# Altium project V3_Board.PrjPcb (part 9 of 9)

## Sheet GSM_Sheet.SchDoc
size A3
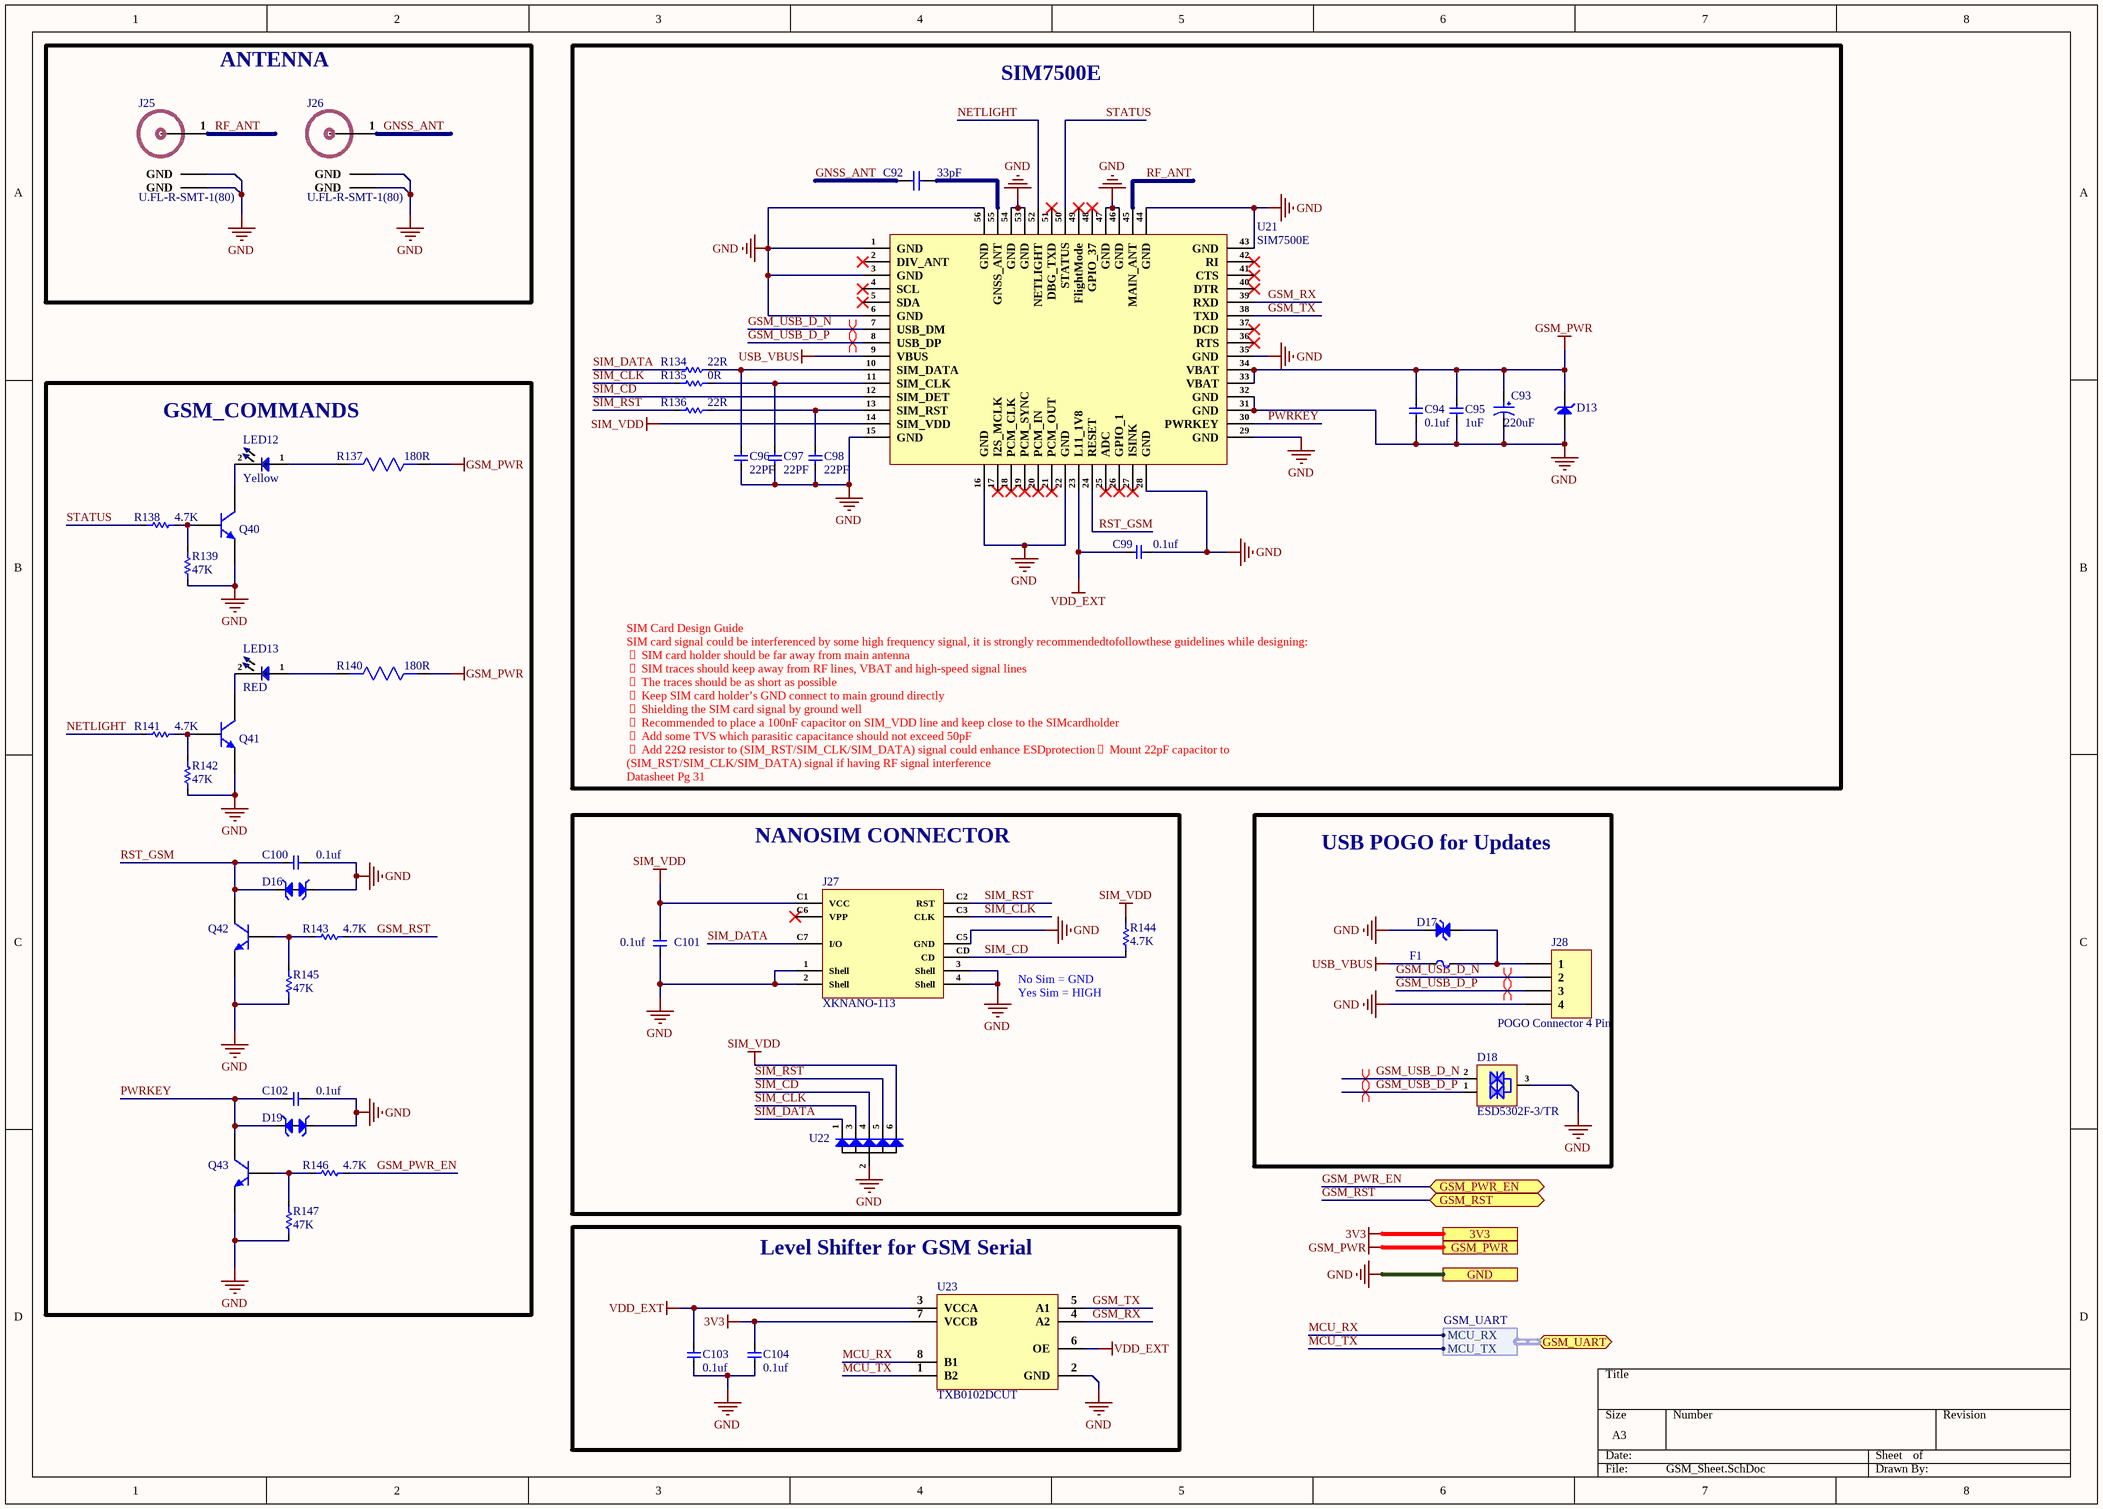
[diagram p20: GSM_Sheet.SchDoc]

### Parts
C92  33pF  [Cap-0402]
C93  220uF  [Case-B]
C94  0.1uf  [Cap-0402]
C95  1uF  [Cap-0402]
C96  22PF  [Cap-0402]
C97  22PF  [Cap-0402]
C98  22PF  [Cap-0402]
C99  0.1uf  [Cap-0402]
C100  0.1uf  [Cap-0402]
C101  0.1uf  [Cap-0402]
C102  0.1uf  [Cap-0402]
C103  0.1uf  [Cap-0402]
C104  0.1uf  [Cap-0402]
D13  MMSZ5231BT1G  [SOD-123]  (value not drawn)
D16  ESD5651N-2/TR  [DFN1006-2L_]  (value not drawn)
D17  PESD5V0H1BSFYL  [DSN0603-2]  (value not drawn)
D18  ESD5302F-3/TR  [Sot-23]
D19  ESD5651N-2/TR  [DFN1006-2L_]  (value not drawn)
F1  SMD0603-050  [Fuse-0603]  (value not drawn)
J25  U.FL-R-SMT-1(80)  [U.FL-R-SMT-1(80)_]
J26  U.FL-R-SMT-1(80)  [U.FL-R-SMT-1(80)_]
J27  XKNANO-113  [XKNANO-113]
J28  POGO Connector 4 Pin  [Pogo 4 Pin]
LED12  Yellow  [LED-0603]
LED13  RED  [LED-0603]
Q40  MMBT2222A-7-F  [SOT-23]  (value not drawn)
Q41  MMBT2222A-7-F  [SOT-23]  (value not drawn)
Q42  MMBT2222A-7-F  [SOT-23]  (value not drawn)
Q43  MMBT2222A-7-F  [SOT-23]  (value not drawn)
R134  22R  [Res-0402]
R135  0R  [Res-0402]
R136  22R  [Res-0402]
R137  180R  [Res-0603]
R138  4.7K  [Res-0402]
R139  47K  [Res-0402]
R140  180R  [Res-0603]
R141  4.7K  [Res-0402]
R142  47K  [Res-0402]
R143  4.7K  [Res-0402]
R144  4.7K  [Res-0402]
R145  47K  [Res-0402]
R146  4.7K  [Res-0402]
R147  47K  [Res-0402]
U21  SIM7500E  [SIM7500E]
U22  SMF05CT1G-ES  [SOT-363]  (value not drawn)
U23  TXB0102DCUT  [VSSOP-8(2x2.3x0.5)]

### Blocks framed on the sheet
ANTENNA: J25 J26
SIM7500E: C92-C99 D13 R134-R136 U21
GSM_COMMANDS: C100 C102 D16 D19 LED12 LED13 Q40-Q43 R137-R143 R145-R147
NANOSIM CONNECTOR: C101 J27 R144 U22
USB POGO for Updates: D17 D18 F1 J28
Level Shifter for GSM Serial: C103 C104 U23

### Ports
3V3, GND, GSM_PWR, GSM_PWR_EN (bidir), GSM_RST (bidir), GSM_UART (bidir, harness GSM_UART)

### Harnesses
GSM_UART: MCU_RX, MCU_TX

### Nets
3V3: C104.1 U23.7(VCCB) ; port 3V3
GND: C93.2 C94.1 C95.1 C96.1 C97.1 C98.1 C99.2 C100.1 C101.2 C102.1 C103.2 C104.2 D13.1(A) D16.2(K) D17.1(A) D18.3(GND) D19.2(K) J25.2(GND) J25.3(GND) J26.2(GND) J26.3(GND) J27.1(Shell) J27.2(Shell) J27.3(Shell) J27.4(Shell) J27.C5(GND) J28.4 Q40.2(E) Q41.2(E) Q42.2(E) Q43.2(E) R139.1 R142.1 R145.1 R147.1 U21.1(GND) U21.3(GND) U21.6(GND) U21.15(GND) U21.16(GND) U21.22(GND) U21.28(GND) U21.29(GND) U21.31(GND) U21.32(GND) U21.35(GND) U21.43(GND) U21.44(GND) U21.46(GND) U21.47(GND) U21.53(GND) U21.54(GND) U21.56(GND) U22.2(A) U23.2(GND) ; port GND
GSM_PWR: C93.1 C94.2 C95.2 D13.2(K) R137.1 R140.1 U21.33(VBAT) U21.34(VBAT) ; port GSM_PWR
SIM_VDD: C101.1 J27.C1(VCC) R144.1 U21.14(SIM_VDD) U22.6(IO5)
USB_VBUS: F1.1 U21.9(VBUS)
VDD_EXT: C99.1 C103.1 U21.23(L11_1V8) U23.3(VCCA) U23.6(OE)
GNSS_ANT: C92.2 J26.1(RF_IN)
GSM_PWR_EN: R146.2 ; port GSM_PWR_EN
GSM_RST: R143.2 ; port GSM_RST
GSM_RX: U21.39(RXD) U23.4(A2)
GSM_TX: U21.38(TXD) U23.5(A1)
GSM_USB_D_N: D18.2(I/O2) J28.2 U21.7(USB_DM)
GSM_USB_D_P: D18.1(I/O1) J28.3 U21.8(USB_DP)
MCU_RX: U23.8(B1) ; port GSM_UART.MCU_RX
MCU_TX: U23.1(B2) ; port GSM_UART.MCU_TX
NETLIGHT: R141.1 U21.52(NETLIGHT)
PWRKEY: C102.2 D19.1(K) Q43.3(C) U21.30(PWRKEY)
RF_ANT: J25.1(RF_IN) U21.45(MAIN_ANT)
RST_GSM: C100.2 D16.1(K) Q42.3(C) U21.24(RESET)
SIM_CD: J27.CD R144.2 U21.12(SIM_DET) U22.4(IO3)
SIM_CLK: J27.C3(CLK) R135.1 U22.3(IO2)
SIM_DATA: J27.C7(I/O) R134.1 U22.1(IO1)
SIM_RST: J27.C2(RST) R136.1 U22.5(IO4)
STATUS: R138.1 U21.50(STATUS)
NetC92_1: C92.1 U21.55(GNSS_ANT)
NetC96_2: C96.2 R134.2 U21.10(SIM_DATA)
NetC97_2: C97.2 R135.2 U21.11(SIM_CLK)
NetC98_2: C98.2 R136.2 U21.13(SIM_RST)
NetD17_2: D17.2(A) F1.2 J28.1
NetLED12_1: LED12.1 R137.2
NetLED12_2: LED12.2 Q40.3(C)
NetLED13_1: LED13.1 R140.2
NetLED13_2: LED13.2 Q41.3(C)
NetQ40_1: Q40.1(B) R138.2 R139.2
NetQ41_1: Q41.1(B) R141.2 R142.2
NetQ42_1: Q42.1(B) R143.1 R145.2
NetQ43_1: Q43.1(B) R146.1 R147.2

Not connected (* = marked no-connect by the designer): J27 C6(VPP)*; U21 2(DIV_ANT)* 4(SCL)* 5(SDA)* 17(I2S_MCLK)* 18(PCM_CLK)* 19(PCM_SYNC)* 20(PCM_IN)* 21(PCM_OUT)* 25(ADC)* 26(GPIO_1)* 27(ISINK)* 36(RTS)* 37(DCD)* 40(DTR)* 41(CTS)* 42(RI)* 48(GPIO_37)* 49(FlightMode)* 51(DBG_TXD)*

### Layout directives
differential pair; net class GSM_USB; differential pair class GSM_USB_Lines; rule Impedance Constraint [Min = 88.00    Max = 90.00    ]; rule Matched Net Lengths [Tolerance = 20mil]: GSM_USB_D_N, GSM_USB_D_P

### Notes on the sheet
- SIM Card Design Guide
  SIM card signal could be interferenced by some high frequency signal, it is strongly recommendedtofollowthese guidelines while designing:
   SIM card holder should be far away from main antenna
   SIM traces should keep away from RF lines, VBAT and high-speed signal lines
   The traces should be as short as possible
   Keep SIM card holder’s GND connect to main ground directly
   Shielding the SIM card signal by ground well
   Recommended to place a 100nF capacitor on SIM_VDD line and keep close to the SIMcardholder
   Add some TVS which parasitic capacitance should not exceed 50pF
   Add 22Ω resistor to (SIM_RST/SIM_CLK/SIM_DATA) signal could enhance ESDprotection Mount 22pF capacitor to (SIM_RST/SIM_CLK/SIM_DATA) signal if having RF signal interference
  Datasheet Pg 31
- (near R144) No Sim = GND
  Yes Sim = HIGH

### Library data of the parts
C92 = GRM1555C1E330JA01D: CAP CER 33PF 25V C0G/NP0 0402; Manufacturer: Murata; Tolerance: 5%; Dielectric: C0G; Supplier 1: Digi-Key; Manufacturer Part Number: GRM1555C1E330JA01D; Stock 1: 250773; Pricing 1: 1=0.1, 10=0.034, 50=0.0184, 100=0.0151, 500=0.01078, 1000=0.00847, 2500=0.0077, 5000=0.00708 (USD); Mount: Surface Mount; Case/Package: 0402; Case Code (Metric): 1005; Case Code (Imperial): 0402; Min Operating Temperature: -55°C; Max Operating Temperature: 125°C; Capacitance: 33pF; Package Quantity: 1; Voltage Rating: 25V; Packaging: Tape and Reel; Voltage Rating (DC): 25V; Termination: SMD/SMT; Voltage: 25V; Series: GRM; Construction: Flat; Length: 1mm; Width: 0.02inch; Height: 0.5mm; Thickness: 0.022inch; Depth: 0.5mm; Radiation Hardening: No; Lead Free: Lead Free; RoHS Compliant: Yes; ComponentLink1URL: https://www.murata.com/~/media/webrenewal/support/library/catalog/products/capacitor/mlcc/c02e.ashx?la=en-us&src-supplier=Digi-Key; ComponentLink1Description: https://www.murata.com/~/media/webrenewal/support/library/catalog/products/capacitor/mlcc/c02e.ashx?la=en-us&src-supplier=Digi-Key; ComponentLink2URL: http://www.mouser.com/ds/2/281/c02e-2905.pdf?src-supplier=Mouser; ComponentLink2Description: http://www.mouser.com/ds/2/281/c02e-2905.pdf?src-supplier=Mouser; ComponentLink3URL: http://psearch.murata.com/capacitor/product/GRM1555C1E330JA01%23.pdf?src-supplier=Avnet; ComponentLink3Description: http://psearch.murata.com/capacitor/product/GRM1555C1E330JA01%23.pdf?src-supplier=Avnet; Supplier Part Number 1: 490-6177-1-ND; LCSC Part Number: C441758
C93 = TLJB227M006R0500: CAP TANT 220UF 20% 6.3V SMD; Manufacturer: Kyocera AVX; Dielectric Material: Tantalum; Ripple Current: 412mA; ESR (Equivalent Series Resistance): 500mR; Leakage Current: 13.2uA; Polarity: Polar; Item Type: Capacitor; Supplier 1: Arrow Electronics; Manufacturer Part Number: TLJB227M006R0500; RoHS: Yes; Category: Tantalum Capacitors; Stock 1: 2000; Pricing 1: 2000=0.5308 (USD); Mounting Technology: Surface Mount; Case/Package: 1210; Pins: 2; Case Code (Imperial): 1411; Case Code (Metric): 3528; Min Operating Temperature: -55°C; Max Operating Temperature: 125°C; Package Quantity: 2000; Voltage Rating: 6.3V; Tolerance: 20%; Packaging: Tape and Reel; Value: 220uF; Termination: SMD/SMT; Voltage Rating (DC): 6.3V; Features: General Purpose; Series: TLJ; Construction: Flat; Length: 3.5mm; Width: 2.8mm; Height: 2.1mm; Height - Seated (Max): 0.083inch; Depth: 2.8mm; Radiation Hardening: No; Reach SVHC Compliant: No; RoHS Compliant: Yes; ComponentLink1URL: https://datasheet.ciiva.com/7773/tlj-7773835.pdf?src-supplier=Element14; ComponentLink1Description: https://datasheet.ciiva.com/7773/tlj-7773835.pdf?src-supplier=Element14; ComponentLink2URL: https://datasheet.ciiva.com/7773/tlj-7773836.pdf?src-supplier=Element14; ComponentLink2Description: https://datasheet.ciiva.com/7773/tlj-7773836.pdf?src-supplier=Element14; ComponentLink3URL: https://datasheet.ciiva.com/12911/tlj-35067-12911143.pdf?src-supplier=Mouser; ComponentLink3Description: https://datasheet.ciiva.com/12911/tlj-35067-12911143.pdf?src-supplier=Mouser; ComponentLink4URL: https://datasheet.ciiva.com/11229/tlj-11229391.pdf?src-supplier=Avnet; ComponentLink4Description: https://datasheet.ciiva.com/11229/tlj-11229391.pdf?src-supplier=Avnet; ComponentLink5URL: https://datasheet.ciiva.com/6238/tlj-6238526.pdf?src-supplier=Digi-Key; ComponentLink5Description: https://datasheet.ciiva.com/6238/tlj-6238526.pdf?src-supplier=Digi-Key; Supplier Part Number 1: TLJB227M006R0500; LCSC Part Number: C30242
C94 C99-C104 = GRM155R62A104KE14D: CAP CER 0.1UF 100V X5R 0402; Manufacturer: Murata; Capacitance: 100nF; Tolerance: 10%; Item Type: Capacitor; Supplier 1: Arrow Electronics; Manufacturer Part Number: GRM155R62A104KE14D; RoHS: Yes; Category: Ceramic Capacitors; Stock 1: 870000; Pricing 1: 10000=0.00500, 20000=0.00410, 30000=0.00390, 50000=0.00370, 100000=0.00300 (USD); Mount: Surface Mount; Case/Package: 0402; Case Code (Metric): 1005; Case Code (Imperial): 0402; Weight: 0.000212oz; Min Operating Temperature: -55°C; Max Operating Temperature: 85°C; Packaging: Tape and Reel; Voltage Rating: 100V; Dielectric: X5R; Termination: SMD/SMT; Voltage Rating (DC): 100V; Package Quantity: 10000; Series: GRM; Length: 0.039inch; Width: 0.02inch; Height: 0.5mm; Thickness: 0.022inch; Reach SVHC Compliant: Yes; Lead Free: Lead Free; RoHS Compliant: Yes; ComponentLink1URL: http://www.farnell.com/datasheets/2079151.pdf?src-supplier=Farnell; ComponentLink1Description: http://www.farnell.com/datasheets/2079151.pdf?src-supplier=Farnell; ComponentLink2URL: http://www.mouser.com/ds/2/281/c02e-2905.pdf?src-supplier=Mouser; ComponentLink2Description: http://www.mouser.com/ds/2/281/c02e-2905.pdf?src-supplier=Mouser; ComponentLink3URL: http://www.farnell.com/datasheets/2079151.pdf?src-supplier=Element14; ComponentLink3Description: http://www.farnell.com/datasheets/2079151.pdf?src-supplier=Element14; ComponentLink4URL: http://search.murata.co.jp/Ceramy/image/img/A01X/G101/ENG/GRM155R62A104KE14-01.pdf?src-supplier=Digi-Key; ComponentLink4Description: http://search.murata.co.jp/Ceramy/image/img/A01X/G101/ENG/GRM155R62A104KE14-01.pdf?src-supplier=Digi-Key; ComponentLink5URL: http://www.farnell.com/datasheets/2079151.pdf?src-supplier=Newark; ComponentLink5Description: http://www.farnell.com/datasheets/2079151.pdf?src-supplier=Newark; Supplier Part Number 1: GRM155R62A104KE14D; LCSC Part Number: C162178
C95 = UMK105CBJ105MV-F: CAP CER 1UF 50V X5R 0402; Manufacturer: Taiyo Yuden; Item Type: Capacitor; Supplier 1: Digi-Key; Manufacturer Part Number: UMK105CBJ105MV-F; Stock 1: 412061; Pricing 1: 1=0.27, 10=0.184, 50=0.1224, 100=0.104, 500=0.07342, 1000=0.06424, 2500=0.06118, 5000=0.05659 (USD); Lead Free: Lead Free; RoHS Compliant: Yes; ComponentLink1URL: http://www.farnell.com/datasheets/2801300.pdf?src-supplier=Newark; ComponentLink1Description: http://www.farnell.com/datasheets/2801300.pdf?src-supplier=Newark; ComponentLink2URL: http://www.farnell.com/datasheets/2801300.pdf?src-supplier=Farnell; ComponentLink2Description: http://www.farnell.com/datasheets/2801300.pdf?src-supplier=Farnell; ComponentLink3URL: https://ds.yuden.co.jp/TYCOMPAS/ut/detail?pn=UMK105CBJ105MV-F &amp;u=M&src-supplier=Digi-Key; ComponentLink3Description: https://ds.yuden.co.jp/TYCOMPAS/ut/detail?pn=UMK105CBJ105MV-F &amp;u=M&src-supplier=Digi-Key; Supplier Part Number 1: 587-6278-1-ND; LCSC Part Number: C2880413
C96-C98 = CC0402JRNPO9BN220: CAP CER 22PF 50V C0G/NPO 0402; Manufacturer: Yageo; Dielectric Material: Ceramic; Tolerance: 5%; Dielectric: C0G; Temperature Coefficient: 30ppm/°C; Insulation Resistance: 100GR; Item Type: Capacitor; Supplier 1: Future Electronics; Manufacturer Part Number: CC0402JRNPO9BN220; RoHS: Yes; Category: Ceramic Capacitors; Stock 1: 200000; Pricing 1: 10000=0.00220, 40000=0.00210, 150000=0.00200, 400000=0.00190, 1000000=0.00180 (USD); Mounting Technology: Surface Mount; Case/Package: 0402; Pins: 2; Case Code (Metric): 1005; Case Code (Imperial): 0402; Min Operating Temperature: -55°C; Max Operating Temperature: 125°C; Value: 22pF; Voltage Rating: 50V; Packaging: Tape and Reel; Package Quantity: 1; Voltage Rating (DC): 50V; Termination: SMD/SMT; Resistor Type: Ceramic; Voltage: 50V; Series: CC; Length: 1mm; Width: 0.02inch; Height: 0.5mm; Thickness: 0.022inch; Depth: 0.5mm; Radiation Hardening: No; Reach SVHC Compliant: Yes; Lead Free: Lead Free; RoHS Compliant: Yes; ComponentLink1URL: https://datasheet.ciiva.com/5789/1443161-5789509.pdf?src-supplier=Farnell; ComponentLink1Description: https://datasheet.ciiva.com/5789/1443161-5789509.pdf?src-supplier=Farnell; ComponentLink2URL: https://datasheet.ciiva.com/8033/1443161-8033606.pdf?src-supplier=Element14; ComponentLink2Description: https://datasheet.ciiva.com/8033/1443161-8033606.pdf?src-supplier=Element14; ComponentLink3URL: https://datasheet.ciiva.com/7656/1132289-7656615.pdf?src-supplier=Element14; ComponentLink3Description: https://datasheet.ciiva.com/7656/1132289-7656615.pdf?src-supplier=Element14; ComponentLink4URL: https://datasheet.ciiva.com/8033/1443161-8033607.pdf?src-supplier=Element14; ComponentLink4Description: https://datasheet.ciiva.com/8033/1443161-8033607.pdf?src-supplier=Element14; ComponentLink5URL: https://datasheet.ciiva.com/8033/1443161-8033605.pdf?src-supplier=Element14; ComponentLink5Description: https://datasheet.ciiva.com/8033/1443161-8033605.pdf?src-supplier=Element14; ComponentLink6URL: https://datasheet.ciiva.com/143/mlccorderingcode-143987.pdf?src-supplier=Digi-Key; ComponentLink6Description: https://datasheet.ciiva.com/143/mlccorderingcode-143987.pdf?src-supplier=Digi-Key; ComponentLink7URL: https://datasheet.ciiva.com/143/mlccorderingcode-143986.pdf?src-supplier=Digi-Key; ComponentLink7Description: https://datasheet.ciiva.com/143/mlccorderingcode-143986.pdf?src-supplier=Digi-Key; ComponentLink8URL: https://datasheet.ciiva.com/143/mlccorderingcode-143988.pdf?src-supplier=Digi-Key; ComponentLink8Description: https://datasheet.ciiva.com/143/mlccorderingcode-143988.pdf?src-supplier=Digi-Key; ComponentLink9URL: https://datasheet.ciiva.com/5425/upy-gp-np0-16v-to-50v-8-5425483.pdf?src-supplier=Mouser; ComponentLink9Description: https://datasheet.ciiva.com/5425/upy-gp-np0-16v-to-50v-8-5425483.pdf?src-supplier=Mouser; ComponentLink10URL: https://datasheet.ciiva.com/15189/getdatasheetpartid-370074-15189117.pdf?src-supplier=Verical; ComponentLink10Description: https://datasheet.ciiva.com/15189/getdatasheetpartid-370074-15189117.pdf?src-supplier=Verical; Supplier Part Number 1: 9105957; LCSC Part Number: C106203
D13 = MMSZ5231BT1G: DIODE ZENER 5.1V 500MW SOD123; Manufacturer: ON Semiconductor; Material: Plastic; Max Reverse Leakage Current: 5uA; Impedance: 17R; Tolerance: 5%; Zener Current: 10mA; Test Current: 20mA; Forward Voltage: 900mV; Breakdown Voltage: 5.36V; Supplier 1: Allied Electronics; Manufacturer Part Number: MMSZ5231BT1G; RoHS: Yes; Category: Zener Diodes; Case/Package: SOD-123-2; Pins: 2; Min Operating Temperature: -55°C; Max Operating Temperature: 150°C; Max Power Dissipation: 500mW; Packaging: Tape and Reel; Zener Voltage: 5.1V; Package Quantity: 3000; Series: Automotive, AEC-Q101; Voltage Tolerance: 5%; Power Dissipation: 500mW; Working Voltage: 5.1V; Max Reverse Current: 5uA; Voltage Rating (DC): 5.1V; Power Rating: 500mW; Length: 2.69mm; Width: 1.6mm; Height: 1.12mm; RoHS Compliant: Yes; Lead Free: Lead Free; Reach SVHC Compliant: No; ComponentLink1URL: https://datasheet.ciiva.com/23815/1708301-23815376.pdf?src-supplier=Newark; ComponentLink1Description: https://datasheet.ciiva.com/23815/1708301-23815376.pdf?src-supplier=Newark; ComponentLink2URL: https://datasheet.ciiva.com/22626/1708301-22626967.pdf?src-supplier=Element14; ComponentLink2Description: https://datasheet.ciiva.com/22626/1708301-22626967.pdf?src-supplier=Element14; ComponentLink3URL: https://datasheet.ciiva.com/4731/mmsz5221bt1-d-4731452.pdf?src-supplier=Mouser; ComponentLink3Description: https://datasheet.ciiva.com/4731/mmsz5221bt1-d-4731452.pdf?src-supplier=Mouser; ComponentLink4URL: https://datasheet.ciiva.com/16200/mmsz5221bt1-d-16200104.pdf?src-supplier=Future+Electronics; ComponentLink4Description: https://datasheet.ciiva.com/16200/mmsz5221bt1-d-16200104.pdf?src-supplier=Future+Electronics; ComponentLink5URL: https://datasheet.ciiva.com/894/mmsz5221bt1-d-894882.pdf?src-supplier=Digi-Key; ComponentLink5Description: https://datasheet.ciiva.com/894/mmsz5221bt1-d-894882.pdf?src-supplier=Digi-Key; ComponentLink6URL: https://datasheet.ciiva.com/894/mmsz5221bt1-d-894883.pdf?src-supplier=Digi-Key; ComponentLink6Description: https://datasheet.ciiva.com/894/mmsz5221bt1-d-894883.pdf?src-supplier=Digi-Key; ComponentLink7URL: https://datasheet.ciiva.com/894/mmsz5221bt1-d-894881.pdf?src-supplier=Digi-Key; ComponentLink7Description: https://datasheet.ciiva.com/894/mmsz5221bt1-d-894881.pdf?src-supplier=Digi-Key; Supplier Part Number 1: 70099546; LCSC Part Number: C66198; Item Type: Diode
D16 D19 = ESD5651N-2/TR: 35A@8/20us 15V 4.5V@Max Unidirectional DFN1006 TVS ROHS; Manufacturer: WILLSEMI(Will Semicon); Item Type: Diode; Manufacturer Part Number: ESD5651N-2/TR; Package: DFN1006; LCSC Part Number: C239784; ComponentLink1Description: LCSC; ComponentLink1URL: https://www.lcsc.com/product-detail/TVS_WILLSEMI-Will-Semicon-ESD5651N-2-TR_C239784.html
D17 = PESD5V0H1BSFYL: TVS DIODE 5VWM 6.3VC DSN0603-2; Manufacturer: Nexperia; Supplier 1: Avnet; Manufacturer Part Number: PESD5V0H1BSFYL; RoHS: Yes; Category: ESD and Circuit Protection ICs; Stock 1: 9000; Pricing 1: 18000=0.06453, 36000=0.06278, 54000=0.06104, 90000=0.05930, 180000=0.05755, 900000=0.05581, 1800000=0.05406 (USD); RoHS Compliant: Yes; ComponentLink1URL: http://www.farnell.com/datasheets/1961312.pdf?src-supplier=Farnell; ComponentLink1Description: http://www.farnell.com/datasheets/1961312.pdf?src-supplier=Farnell; ComponentLink2URL: https://assets.nexperia.com/documents/data-sheet/PESD5V0H1BSF.pdf?src-supplier=Digi-Key; ComponentLink2Description: https://assets.nexperia.com/documents/data-sheet/PESD5V0H1BSF.pdf?src-supplier=Digi-Key; ComponentLink3URL: http://www.farnell.com/datasheets/1961312.pdf?src-supplier=Newark; ComponentLink3Description: http://www.farnell.com/datasheets/1961312.pdf?src-supplier=Newark; Supplier Part Number 1: PESD5V0H1BSFYL; LCSC Part Number: C477989; Item Type: Diode
D18 = ESD5302F-3/TR: 16A 20V 7V 5V@Max Unidirectional SOT-23 TVS ROHS; Manufacturer: WILLSEMI; Item Type: Diode; Manufacturer Part Number: ESD5302F-3/TR; Package: SOT-23; LCSC Part Number: C239643; ComponentLink1Description: LCSC; ComponentLink1URL: https://www.lcsc.com/product-detail/TVS_WILLSEMI-Will-Semicon-ESD5302F-3-TR_C239643.html
F1 = SMD0603-050: 6V 500mA 40A 1A 0603 Resettable Fuses ROHS; Manufacturer: TECHFUSE; Item Type: Fuse; Supplier 1: LCSC; Manufacturer Part Number: SMD0603-050; RoHS: No; Category: Uncategorized; Supplier Part Number 1: C69679; LCSC Part Number: C69679; ComponentLink1Description: LCSC; ComponentLink1URL: https://www.lcsc.com/product-detail/Resettable-Fuses_TECHFUSE-SMD0603-050_C69679.html
J25 J26 = U.FL-R-SMT-1(80): CONN U.FL RCPT STR 50 OHM SMD; Manufacturer: Hirose; Supplier 1: Future Electronics; Manufacturer Part Number: U.FL-R-SMT-1(80); Stock 1: 1272; Pricing 1: 1=1.07, 500=0.785, 1500=0.74, 2500=0.72, 5000=0.695 (USD); Case/Package: SMD/SMT; Package Quantity: 10000; Packaging: Tape and Reel; Lead Free: Lead Free; ComponentLink1URL: https://www.hirose.com/product/en/download_file/key_name/U.FL-R-SMT-1%2880%29/category/Specification%20Sheet/doc_file_id/37638/?file_category_id=9&item_id=03310472280&is_series=&src-supplier=Digi-Key; ComponentLink1Description: https://www.hirose.com/product/en/download_file/key_name/U.FL-R-SMT-1%2880%29/category/Specification%20Sheet/doc_file_id/37638/?file_category_id=9&item_id=03310472280&is_series=&src-supplier=Digi-Key; ComponentLink2URL: http://www.mouser.com/ds/2/185/U.FL_catalog-939761.pdf?src-supplier=Mouser; ComponentLink2Description: http://www.mouser.com/ds/2/185/U.FL_catalog-939761.pdf?src-supplier=Mouser; Supplier Part Number 1: U.FL-R-SMT-1(80)-CUTT; LCSC Part Number: C88374
J27 = XKNANO-113: Copper Alloy Self bomb Gold plating 1.25mm Deck -40℃~+85℃ 260℃ NanoSIM SMD SIM Card Connectors ROHS; Manufacturer: XKB Connectivity; Manufacturer Part Number: XKNANO-113; Package: SMD Custom; LCSC Part Number: C381071; Item Type: SIM Card Connectors; ComponentLink1Description: LCSC; ComponentLink1URL: https://www.lcsc.com/product-detail/SIM-Card-Connectors_XKB-Connectivity-XKNANO-113_C381071.html
J28 = POGO Connector 4 Pin: Pogo Pad 2.5mm 4 Pin; Item Type: Pogo Connector; Manufacturer Part Number: POGO Connector 4 Pin
LED12 = 19-21/G6C-FM1N2B/3T: Yellow-Green 572nm LED Indication - Discrete 2.05V 0603 (1608 Metric); Manufacturer: Everlight Elec; Manufacturer Part Number: 19-21/G6C-FM1N2B/3T; Package: 0603; LCSC Part Number: C93689; Item Type: LED; ComponentLink1Description: LCSC; ComponentLink1URL: https://www.lcsc.com/product-detail/Light-Emitting-Diodes-LED_Everlight-Elec-19-21-G6C-FM1N2B-3T_C93689.html
LED13 = 19-21/R7C-AK1L2BY/3T: Red 632nm LED Indication - Discrete 2.05V 0603 (1608 Metric); Manufacturer: Everlight Elec; Manufacturer Part Number: 19-21/R7C-AK1L2BY/3T; Package: 0603; LCSC Part Number: C1322287; Item Type: LED; ComponentLink1Description: LCSC; ComponentLink1URL: https://www.lcsc.com/product-detail/Light-Emitting-Diodes-LED_Everlight-Elec-19-21-R7C-AK1L2BY-3T_C1322287.html
Q40-Q43 = MMBT2222A-7-F: TRANS NPN 40V 0.6A SMD SOT23-3; Manufacturer: Diodes; Max Power Dissipation: 300mW; Collector Base Voltage (VCBO): 75V; Max Collector Current: 600mA; hFE Min: 100; Frequency: 300MHz; Number of Elements: 1; Emitter Base Voltage (VEBO): 6V; Collector Emitter Saturation Voltage: 1V; Power Dissipation: 350mW; Element Configuration: Single; Current: 1A; Item Type: Mosfet; Supplier 1: Digi-Key; Manufacturer Part Number: MMBT2222A-7-F; Stock 1: 2471182; Pricing 1: 1=0.15, 10=0.134, 100=0.0729, 500=0.04486, 1000=0.03059 (USD); Mount: Surface Mount; Case/Package: SOT-23; Number of Pins: 3; Weight: 0.000282oz; Contact Plating: Matte,Tin; Min Operating Temperature: -55°C; Max Operating Temperature: 150°C; Packaging: Tape and Reel; Collector Emitter Voltage (VCEO): 40V; Polarity: NPN; Voltage Rating (DC): 40V; Package Quantity: 3000; Continuous Collector Current: 600mA; Collector Emitter Breakdown Voltage: 40V; Transition Frequency: 300MHz; Max Breakdown Voltage: 40V; Max Frequency: 300MHz; Termination: SMD/SMT; Gain Bandwidth Product: 300MHz; Current Rating: 600mA; Voltage: 40V; Length: 3.05mm; Height: 1mm; Width: 1.4mm; Radiation Hardening: No; Lead Free: Lead Free; REACH SVHC: No SVHC; ComponentLink1URL: http://www.diodes.com/datasheets/ds30041.pdf?src-supplier=Future+Electronics; ComponentLink1Description: http://www.diodes.com/datasheets/ds30041.pdf?src-supplier=Future+Electronics; ComponentLink2URL: http://www.diodes.com/datasheets/ds30041.pdf?src-supplier=Avnet; ComponentLink2Description: http://www.diodes.com/datasheets/ds30041.pdf?src-supplier=Avnet; ComponentLink3URL: https://www.verical.com/server-webapp/html/getDatasheet?partID=82692&src-supplier=Verical; ComponentLink3Description: https://www.verical.com/server-webapp/html/getDatasheet?partID=82692&src-supplier=Verical; ComponentLink4URL: https://www.diodes.com/assets/Datasheets/ds30041.pdf?src-supplier=Digi-Key; ComponentLink4Description: https://www.diodes.com/assets/Datasheets/ds30041.pdf?src-supplier=Digi-Key; ComponentLink5URL: http://www.diodes.com/datasheets/ds30041.pdf?src-supplier=Avnet+Europe; ComponentLink5Description: http://www.diodes.com/datasheets/ds30041.pdf?src-supplier=Avnet+Europe; ComponentLink6URL: http://www.diodes.com/datasheets/ds30041.pdf?src-supplier=Element14; ComponentLink6Description: http://www.diodes.com/datasheets/ds30041.pdf?src-supplier=Element14; Supplier Part Number 1: MMBT2222A-FDIDKR-ND; LCSC Part Number: C94515
R134 R136 = RCS040222R0FKED: RES SMD 22 OHM 1% 1/5W 0402; Manufacturer: Vishay Dale; Max Power Dissipation: 200mW; Temperature Coefficient: 100ppm/°C; Supplier 1: Digi-Key; Manufacturer Part Number: RCS040222R0FKED; Stock 1: 8456; Pricing 1: 1=0.12, 10=0.105, 100=0.0402, 1000=0.01771, 2500=0.0153, 5000=0.01368 (USD); Case/Package: 0402; Case Code (Metric): 1005; Case Code (Imperial): 0402; Min Operating Temperature: -55°C; Max Operating Temperature: 155°C; Packaging: Tape and Reel; Resistance: 22R; Resistor Type: Thick Film; Number of Terminations: 2; Tolerance: 1%; Features: Automotive AEC-Q200; Length: 0.039inch; Width: 0.02inch; Height: 0.016inch; RoHS Compliant: Yes; ComponentLink1URL: http://www.vishay.com/docs/20065/rcse3.pdf?src-supplier=Digi-Key; ComponentLink1Description: http://www.vishay.com/docs/20065/rcse3.pdf?src-supplier=Digi-Key; Supplier Part Number 1: 541-2880-1-ND; LCSC Part Number: C2086081
R135 = RC0402FR-070RL: RES 0 OHM JUMPER 1/16W 0402; Manufacturer: Yageo; Tolerance: 1%; Power Rating: 62.5mW; Voltage Rating: 50V; Temperature Coefficient: 200ppm/°C; Max Power Dissipation: 63mW; Supplier 1: Mouser; Manufacturer Part Number: RC0402FR-070RL; RoHS: Yes; Category: Chip SMD Resistors; Stock 1: 8556842; Pricing 1: 1=0.10000, 10=0.01400, 50=0.01400, 100=0.00600, 1000=0.00300, 5000=0.00200, 10000=0.00100 (USD); Mount: Surface Mount; Case/Package: 0402; Contact Plating: Tin,Matte; Case Code (Imperial): 0402; Case Code (Metric): 1005; Size Code: 0402; Min Operating Temperature: -55°C; Max Operating Temperature: 155°C; Resistance: 0R; Resistor Type: Thick Film; Packaging: Tape and Reel; Termination: SMD/SMT; Features: Moisture Resistant; Series: RC; Number of Terminations: 2; Length: 1mm; Width: 0.5mm; Height: 0.35mm; Radiation Hardening: No; Lead Free: Lead Free; RoHS Compliant: Yes; ComponentLink1URL: https://datasheet.ciiva.com/8896/pyu-rc0402-51-rohs-l-6-8896149.pdf?src-supplier=Avnet; ComponentLink1Description: https://datasheet.ciiva.com/8896/pyu-rc0402-51-rohs-l-6-8896149.pdf?src-supplier=Avnet; ComponentLink2URL: https://datasheet.ciiva.com/16790/pyu-rc0402-51-rohs-l-6-r-16790444.pdf?src-supplier=Future+Electronics; ComponentLink2Description: https://datasheet.ciiva.com/16790/pyu-rc0402-51-rohs-l-6-r-16790444.pdf?src-supplier=Future+Electronics; Supplier Part Number 1: 603-RC0402FR-070RL; LCSC Part Number: C106231
R137 R140 = RC0603FR-07180RL: RES 180 OHM 1% 1/10W 0603; Manufacturer: Yageo; Power Rating: 100mW; Voltage Rating (DC): 50V; Temperature Coefficient: 100ppm/°C; Item Type: Resistor; Supplier 1: Avnet; Manufacturer Part Number: RC0603FR-07180RL; RoHS: Yes; Category: Chip SMD Resistors; Stock 1: 35000; Pricing 1: 5000=0.00133, 10000=0.00131, 20000=0.00127 (USD); Case/Package: 0603; Number of Pins: 2; Case Code (Metric): 1608; Case Code (Imperial): 0603; Size Code: 0603; Min Operating Temperature: -55°C; Max Operating Temperature: 155°C; Tolerance: 1%; Resistance: 180R; Packaging: Tape and Reel; Package Quantity: 1; Voltage Rating: 50V; Resistor Type: Thick Film; Number of Terminations: 2; Termination: SMD/SMT; Max Power Dissipation: 100mW; Features: Moisture Resistant; Series: RC; Construction: Rectangular; Resistance Tolerance: 1%; Length: 1.6mm; Width: 0.8mm; Height: 0.022inch; Depth: 0.8mm; Lead Free: Lead Free; Military Standard: Not; RoHS Compliant: Yes; ComponentLink1URL: https://datasheet.ciiva.com/2454/pyu-r-int-thick-7-2454469.pdf?src-supplier=Digi-Key; ComponentLink1Description: https://datasheet.ciiva.com/2454/pyu-r-int-thick-7-2454469.pdf?src-supplier=Digi-Key; ComponentLink2URL: https://datasheet.ciiva.com/2454/pyu-r-int-thick-7-2454470.pdf?src-supplier=Digi-Key; ComponentLink2Description: https://datasheet.ciiva.com/2454/pyu-r-int-thick-7-2454470.pdf?src-supplier=Digi-Key; ComponentLink3URL: https://datasheet.ciiva.com/2454/pyu-r-int-thick-7-2454468.pdf?src-supplier=Digi-Key; ComponentLink3Description: https://datasheet.ciiva.com/2454/pyu-r-int-thick-7-2454468.pdf?src-supplier=Digi-Key; ComponentLink4URL: https://datasheet.ciiva.com/7746/443971-7746267.pdf?src-supplier=Element14; ComponentLink4Description: https://datasheet.ciiva.com/7746/443971-7746267.pdf?src-supplier=Element14; ComponentLink5URL: https://datasheet.ciiva.com/7746/443971-7746266.pdf?src-supplier=Element14; ComponentLink5Description: https://datasheet.ciiva.com/7746/443971-7746266.pdf?src-supplier=Element14; ComponentLink6URL: https://datasheet.ciiva.com/15189/getdatasheetpartid-325160-15189622.pdf?src-supplier=Verical; ComponentLink6Description: https://datasheet.ciiva.com/15189/getdatasheetpartid-325160-15189622.pdf?src-supplier=Verical; Supplier Part Number 1: RC0603FR-07180RL; LCSC Part Number: C137786
R138 R141 R143 R144 R146 = RC0402FR-074K7L: RES 4.7K OHM 1% 1/16W 0402; Manufacturer: Yageo; Voltage Rating (DC): 50V; Power Rating: 62.5mW; Resistance: 4.7kR; Temperature Coefficient: 100ppm/°C; Max Power Dissipation: 63mW; Item Type: Resistor; Supplier 1: Avnet; Manufacturer Part Number: RC0402FR-074K7L; RoHS: Yes; Category: Chip SMD Resistors; Stock 1: 2420000; Pricing 1: 10000=0.00085 (USD); Case/Package: 0402; Number of Pins: 2; Case Code (Imperial): 0402; Case Code (Metric): 1005; Size Code: 0402; Min Operating Temperature: -55°C; Max Operating Temperature: 155°C; Tolerance: 1%; Voltage Rating: 50V; Packaging: Tape and Reel; Resistor Type: Thick Film; Termination: SMD/SMT; Features: Moisture Resistant; Series: RC; Number of Terminations: 2; Resistance Tolerance: 1%; Construction: Rectangular; Length: 1mm; Width: 0.5mm; Height: 0.32mm; Depth: 0.5mm; Height - Seated (Max): 0.016inch; RoHS Compliant: Yes; Reach SVHC Compliant: Yes; Military Standard: Not; Lead Free: Lead Free; ComponentLink1URL: https://datasheet.ciiva.com/22661/1686128-22661342.pdf?src-supplier=Element14; ComponentLink1Description: https://datasheet.ciiva.com/22661/1686128-22661342.pdf?src-supplier=Element14; ComponentLink2URL: https://datasheet.ciiva.com/7850/1018594-7850022.pdf?src-supplier=Element14; ComponentLink2Description: https://datasheet.ciiva.com/7850/1018594-7850022.pdf?src-supplier=Element14; ComponentLink3URL: https://datasheet.ciiva.com/7850/1018594-7850023.pdf?src-supplier=Element14; ComponentLink3Description: https://datasheet.ciiva.com/7850/1018594-7850023.pdf?src-supplier=Element14; ComponentLink4URL: https://datasheet.ciiva.com/15215/getdatasheetpartid-328119-15215035.pdf?src-supplier=Verical; ComponentLink4Description: https://datasheet.ciiva.com/15215/getdatasheetpartid-328119-15215035.pdf?src-supplier=Verical; Supplier Part Number 1: RC0402FR-074K7L; LCSC Part Number: C105871
R139 R142 R145 R147 = RC0402FR-0747KL: RES 47K OHM 1% 1/16W 0402; Manufacturer: Yageo; Power Rating: 62.5mW; Temperature Coefficient: 100ppm/°C; Voltage Rating: 50V; Resistance: 47kR; Max Power Dissipation: 63mW; Item Type: Resistor; Supplier 1: Avnet; Manufacturer Part Number: RC0402FR-0747KL; RoHS: Yes; Category: Chip SMD Resistors; Stock 1: 680000; Pricing 1: 10000=0.00085, 20000=0.00087, 40000=0.00084, 60000=0.00083, 80000=0.00079, 100000=0.00078, 1000000=0.00076 (USD); Case/Package: 0402; Case Code (Imperial): 0402; Case Code (Metric): 1005; Size Code: 0402; Min Operating Temperature: -55°C; Max Operating Temperature: 155°C; Tolerance: 1%; Series: RC; Packaging: Tape and Reel; Package Quantity: 1; Termination: SMD/SMT; Resistor Type: Thick Film; Number of Terminations: 2; Features: Moisture Resistant; Resistance Tolerance: 1%; Construction: Rectangular; Length: 1mm; Width: 0.02inch; Height: 0.016inch; Depth: 0.5mm; RoHS Compliant: Yes; Military Standard: Not; Lead Free: Lead Free; ComponentLink1URL: https://datasheet.ciiva.com/46412/1018594-46412839.pdf?src-supplier=Element14; ComponentLink1Description: https://datasheet.ciiva.com/46412/1018594-46412839.pdf?src-supplier=Element14; ComponentLink2URL: https://datasheet.ciiva.com/2453/pyu-r-int-thick-7-2453389.pdf?src-supplier=Digi-Key; ComponentLink2Description: https://datasheet.ciiva.com/2453/pyu-r-int-thick-7-2453389.pdf?src-supplier=Digi-Key; ComponentLink3URL: https://datasheet.ciiva.com/2453/pyu-r-int-thick-7-2453390.pdf?src-supplier=Digi-Key; ComponentLink3Description: https://datasheet.ciiva.com/2453/pyu-r-int-thick-7-2453390.pdf?src-supplier=Digi-Key; ComponentLink4URL: https://datasheet.ciiva.com/2453/pyu-r-int-thick-7-2453388.pdf?src-supplier=Digi-Key; ComponentLink4Description: https://datasheet.ciiva.com/2453/pyu-r-int-thick-7-2453388.pdf?src-supplier=Digi-Key; ComponentLink5URL: https://datasheet.ciiva.com/15189/getdatasheetpartid-323748-15189466.pdf?src-supplier=Verical; ComponentLink5Description: https://datasheet.ciiva.com/15189/getdatasheetpartid-323748-15189466.pdf?src-supplier=Verical; ComponentLink6URL: https://datasheet.ciiva.com/16793/pyu-rc0402-51-rohs-l-6-r-16793430.pdf?src-supplier=Future+Electronics; ComponentLink6Description: https://datasheet.ciiva.com/16793/pyu-rc0402-51-rohs-l-6-r-16793430.pdf?src-supplier=Future+Electronics; Supplier Part Number 1: RC0402FR-0747KL; LCSC Part Number: C93943
U21 = SIM7500E: SMD,30x30mm 2G/3G/4G/5G Modules ROHS; Manufacturer: SIMCom; Item Type: IC; Manufacturer Part Number: SIM7500E; Package: SMD,30x30mm; LCSC Part Number: C126259; ComponentLink1Description: LCSC; ComponentLink1URL: https://www.lcsc.com/product-detail/2G-3G-4G-5G-Modules_SIMCom-Wireless-Solutions-SIM7500E_C126259.html
U22 = SMF05CT1G-ES: 15V 5 Unidirectional 5V SOT-363 ESD Protection Devices ROHS; Manufacturer: ElecSuper; Item Type: ESD Diode; Manufacturer Part Number: SMF05CT1G-ES; Package: SOT-363; LCSC Part Number: C5180312; ComponentLink1Description: LCSC; ComponentLink1URL: https://www.lcsc.com/product-detail/ESD-Protection-Devices_ElecSuper-SMF05CT1G-ES_C5180312.html
U23 = TXB0102DCUT: IC TRNSLTR BIDIRECTIONAL US8; Manufacturer: Texas Instruments; Propagation Delay: 31ns; Min Supply Voltage: 1.65V; Max Supply Voltage: 5.5V; Data Rate: 100Mbps; Number of Channels: 2; Logic Function: Translator; Turn-On Delay Time: 7.4ns; High Level Output Current: -20uA; Low Level Output Current: 20uA; Output Type: 3-STATE; Output Current: 50mA; Supplier 1: Arrow Electronics; Manufacturer Part Number: TXB0102DCUT; RoHS: Yes; Category: Integrated Circuits (ICs); Stock 1: 10; Pricing 1: 1=0.79330, 10=0.66470, 25=0.65820, 250=0.37450, 500=0.36200, 1000=0.29770, 2500=0.28440 (USD); Mount: Surface Mount; Case/Package: VSSOP; Number of Pins: 8; Weight: 0.000339oz; Contact Plating: Gold; Min Operating Temperature: -40°C; Max Operating Temperature: 85°C; Packaging: Tape and Reel; Package Quantity: 1; Number of Bits: 2; Series: -; Number of Inputs: 2; Length: 2.3mm; Width: 2mm; Height: 0.85mm; Radiation Hardening: No; Lead Free: Lead Free; RoHS Compliant: Yes; REACH SVHC: No SVHC; ComponentLink1URL: https://datasheet.ciiva.com/4226/sces641b-4226901.pdf?src-supplier=Arrow+Electronics; ComponentLink1Description: https://datasheet.ciiva.com/4226/sces641b-4226901.pdf?src-supplier=Arrow+Electronics; ComponentLink2URL: https://datasheet.ciiva.com/15096/getdatasheetpartid-226009-15096242.pdf?src-supplier=Verical; ComponentLink2Description: https://datasheet.ciiva.com/15096/getdatasheetpartid-226009-15096242.pdf?src-supplier=Verical; ComponentLink3URL: https://datasheet.ciiva.com/14287/txb0102-14287498.pdf?src-supplier=Avnet; ComponentLink3Description: https://datasheet.ciiva.com/14287/txb0102-14287498.pdf?src-supplier=Avnet; ComponentLink4URL: https://datasheet.ciiva.com/14287/txb0102-14287370.pdf?src-supplier=Avnet; ComponentLink4Description: https://datasheet.ciiva.com/14287/txb0102-14287370.pdf?src-supplier=Avnet; ComponentLink5URL: https://datasheet.ciiva.com/6619/txb0102-6619255.pdf?src-supplier=Digi-Key; ComponentLink5Description: https://datasheet.ciiva.com/6619/txb0102-6619255.pdf?src-supplier=Digi-Key; ComponentLink6URL: https://datasheet.ciiva.com/6619/txb0102-6619256.pdf?src-supplier=Digi-Key; ComponentLink6Description: https://datasheet.ciiva.com/6619/txb0102-6619256.pdf?src-supplier=Digi-Key; ComponentLink7URL: https://datasheet.ciiva.com/6619/txb0102-6619257.pdf?src-supplier=Digi-Key; ComponentLink7Description: https://datasheet.ciiva.com/6619/txb0102-6619257.pdf?src-supplier=Digi-Key; Supplier Part Number 1: TXB0102DCUT; LCSC Part Number: C2677366; Item Type: IC

## Nets that join several sheets
3V3: Regulator_Section (5 pins), Connector_Section (8 pins), Temperature_Sense_Section (7 pins), Receiver_Section (C75.2 R54.2 R55.2 R104.2), Controller_Section (16 pins), Switch_Sheet (R18.2 R19.2), Heater_Section (10 pins), Sensor_Section (R23.2 R35.2 R76.2 R79.2), HMI_Encoder_NFC_Sheet (J24.5), Ultra_Sonic_Section (7 pins), GSM_Sheet (C104.1 U23.7)
5V: Current_Sense_Section (6 pins), Regulator_Section (8 pins), Connector_Section (J19.1 R21.2 SB43.1), Receiver_Section (J18.4), Gate_Driver_Section (6 pins), HMI_Encoder_NFC_Sheet (J23.4)
BAT: Reverse Protection_Section (C2.2 J2.1 R149.2), Solar_Charge_Controller (7 pins)
GND: Current_Sense_Section (12 pins), Voltage_Monitoring_Section (5 pins), Regulator_Section (22 pins), Reverse Protection_Section (5 pins), Solar_Charge_Controller (11 pins), Connector_Section (28 pins), Temperature_Sense_Section (7 pins), Receiver_Section (19 pins), Controller_Section (23 pins), Switch_Sheet (C37.1 C38.1 SW1.1 SW2.1), Gate_Driver_Section (9 pins), Heater_Section (32 pins), Sensor_Section (8 pins), LED_Section (8 pins), Valve_Section (20 pins), HMI_Encoder_NFC_Sheet (6 pins), Ultra_Sonic_Section (6 pins), GSM_Sheet (55 pins)
GSM_PWR: Regulator_Section (7 pins), GSM_Sheet (8 pins)
VCC: Current_Sense_Section (U1.3 U1.4 U2.3 U2.4), Reverse Protection_Section (SB40.2), Connector_Section (SB5.1 SB44.1), Controller_Section (R12.1), Heater_Section (16 pins), Sensor_Section (10 pins), LED_Section (P19.1 P20.1), Valve_Section (15 pins), HMI_Encoder_NFC_Sheet (J22.7 J22.8), Ultra_Sonic_Section (J29.1)
VCC#12: Voltage_Monitoring_Section (Q32.3 R34.1 SB39.2), Regulator_Section (D11.2)
VCC#P: Voltage_Monitoring_Section (SB9.1), Reverse Protection_Section (9 pins)
ADC_14: Temperature_Sense_Section (P4.2), Controller_Section (U5.26)
ADC_15: Temperature_Sense_Section (P4.5), Controller_Section (U5.31)
AN1: Temperature_Sense_Section (P8.2), Controller_Section (U5.35)
AN2: Temperature_Sense_Section (P8.5), Controller_Section (U5.36)
AN10: Temperature_Sense_Section (P3.2), Controller_Section (U5.16)
AN11: Temperature_Sense_Section (P3.5), Controller_Section (U5.25)
AN12: Temperature_Sense_Section (P5.2), Controller_Section (U5.33)
AN13: Temperature_Sense_Section (P5.5), Controller_Section (U5.34)
B_CNTRL: Controller_Section (U5.45), LED_Section (Q28.1 R75.1)
BUZZER: Connector_Section (R62.2), Controller_Section (U5.60)
CE: Solar_Charge_Controller (Q39.1), Controller_Section (U5.22)
CRNT_SNS.IP+_1: Current_Sense_Section (U1.1 U1.2), Gate_Driver_Section (D25.2 J3.2)
CRNT_SNS.IP+_2: Current_Sense_Section (U2.1 U2.2), Gate_Driver_Section (D26.2 J4.2)
CRNT_VOUT.VIOUT1: Current_Sense_Section (C11.1 R5.2 R7.1), Controller_Section (U5.18)
CRNT_VOUT.VIOUT2: Current_Sense_Section (C19.1 R8.2 R10.1), Controller_Section (U5.17)
ENA: Controller_Section (U5.7), Gate_Driver_Section (U12.2)
FILL_CNTRL: Controller_Section (U5.5), Valve_Section (Q1.1 R69.1)
FLOW_MCU1: Controller_Section (U5.57), Sensor_Section (R76.1 U8.4)
FLOW_MCU2: Controller_Section (U5.56), Sensor_Section (R35.1 U14.4)
FLOW_MCU3: Controller_Section (U5.55), Sensor_Section (R23.1 U15.4)
FLUSH_CNTRL: Controller_Section (U5.4), Valve_Section (Q2.1 R70.1)
G_CNTRL: Controller_Section (U5.44), LED_Section (Q27.1 R74.1)
GATE_DRV.INA_1: Controller_Section (U5.10), Gate_Driver_Section (U10.2)
GATE_DRV.INB_1: Controller_Section (U5.11), Gate_Driver_Section (U11.2)
GSM_PWR_EN: Controller_Section (U5.97), GSM_Sheet (R146.2)
GSM_RST: Controller_Section (U5.98), GSM_Sheet (R143.2)
HEAT_CNTRL: Controller_Section (U5.53), Heater_Section (R33.1)
HMI_UART.RX_HMI: Controller_Section (U5.86), HMI_Encoder_NFC_Sheet (J22.4)
HMI_UART.TX_HMI: Controller_Section (U5.87), HMI_Encoder_NFC_Sheet (J22.5)
I2C_ENCODER.SCL: Controller_Section (U5.95), HMI_Encoder_NFC_Sheet (J23.2)
I2C_ENCODER.SDA: Controller_Section (U5.96), HMI_Encoder_NFC_Sheet (J23.1)
IO_C9: Controller_Section (U5.54), Heater_Section (R28.1)
IRQ_NFC: Controller_Section (U5.83), HMI_Encoder_NFC_Sheet (J24.7)
LED_SIG.R_CNTRL: Controller_Section (U5.43), LED_Section (Q26.1 R73.1)
LED_SIG.W_LED_CNTRL: Controller_Section (U5.46), LED_Section (Q25.1 R72.1)
LEVEL_MCU: Controller_Section (U5.61), Sensor_Section (R79.1 U9.4)
MCU_RX: Controller_Section (U5.93), GSM_Sheet (U23.8)
MCU_TX: Controller_Section (U5.92), GSM_Sheet (U23.1)
MEM_CNTRL: Controller_Section (U5.3), Valve_Section (Q3.1 R4.1)
MISO_NFC: Controller_Section (U5.84), HMI_Encoder_NFC_Sheet (J24.2)
MOSI_NFC: Controller_Section (U5.85), HMI_Encoder_NFC_Sheet (J24.3)
NRST: Connector_Section (J1.10), Controller_Section (C73.2 SW3.3 U5.14)
PIR_OUT: Connector_Section (R116.2), Controller_Section (U5.66)
PM_CNTRL: Controller_Section (U5.2), Valve_Section (Q4.1 R6.1)
PS_MCU: Connector_Section (SB37.2 SB38.2), Controller_Section (U5.58)
PWM_D2: Connector_Section (Q38.3 R20.1), Controller_Section (U5.59)
RE/DE/RS485/T: Controller_Section (U5.90), Ultra_Sonic_Section (R58.1 R59.1 U24.2 U24.3)
RF_DO: Receiver_Section (SB18.2), Controller_Section (U5.64)
RF_RSSI: Receiver_Section (U16.14), Controller_Section (U5.65)
RS485/RS232/T.RXD/RS485/RS232/T: Controller_Section (U5.89), Ultra_Sonic_Section (R57.1 U24.1)
RS485/RS232/T.TXD/RS485/RS232/T: Controller_Section (U5.91), Ultra_Sonic_Section (R60.1 U24.4)
RS_CNTRL: Controller_Section (U5.1), Valve_Section (Q8.1 R9.1)
RX_D1: Receiver_Section (SB19.1), Controller_Section (U5.62)
RX_D2: Receiver_Section (SB20.1), Controller_Section (U5.63)
RXIN1: Controller_Section (U5.48), Heater_Section (R91.2 R101.1)
RXIN2: Controller_Section (U5.79), Heater_Section (R92.2 R102.1)
SCK_NFC: Controller_Section (U5.82), HMI_Encoder_NFC_Sheet (J24.1)
SHDN: Reverse Protection_Section (R64.2 SB7.2), Controller_Section (U5.15)
SNS_IN: Connector_Section (SB3.2), Controller_Section (U5.67)
SPI_NFC.SS_NFC: Controller_Section (U5.81), HMI_Encoder_NFC_Sheet (J24.4)
SW_1: Controller_Section (U5.69), Switch_Sheet (C37.2 R18.1 SW1.3)
SW_2: Controller_Section (U5.68), Switch_Sheet (C38.2 R19.1 SW2.3)
SWCLK: Connector_Section (J1.4), Controller_Section (U5.76)
SWDIO: Connector_Section (J1.2), Controller_Section (U5.72)
TDS_1: Temperature_Sense_Section (P3.4), Controller_Section (U5.24)
TDS_2: Temperature_Sense_Section (P3.3), Controller_Section (U5.23)
TDS_3: Temperature_Sense_Section (P4.4), Controller_Section (U5.30)
TDS_4: Temperature_Sense_Section (P4.3), Controller_Section (U5.29)
TDS_5: Temperature_Sense_Section (P5.4), Controller_Section (U5.39)
TDS_6: Temperature_Sense_Section (P5.3), Controller_Section (U5.40)
TDS_7: Temperature_Sense_Section (P8.4), Controller_Section (U5.38)
TDS_8: Temperature_Sense_Section (P8.3), Controller_Section (U5.37)
TDS_IN.TEMP_SNS: Temperature_Sense_Section (P6.2), Controller_Section (R31.1 U5.42)
TXIN1: Controller_Section (U5.47), Heater_Section (R47.2)
TXIN2: Controller_Section (U5.78), Heater_Section (R46.2)
USB_D_N: Connector_Section (D4.2 J19.2), Controller_Section (U5.70)
USB_D_P: Connector_Section (D4.1 J19.3), Controller_Section (U5.71)